# Altium project NewTracker.PrjPcb (part 1 of 4)
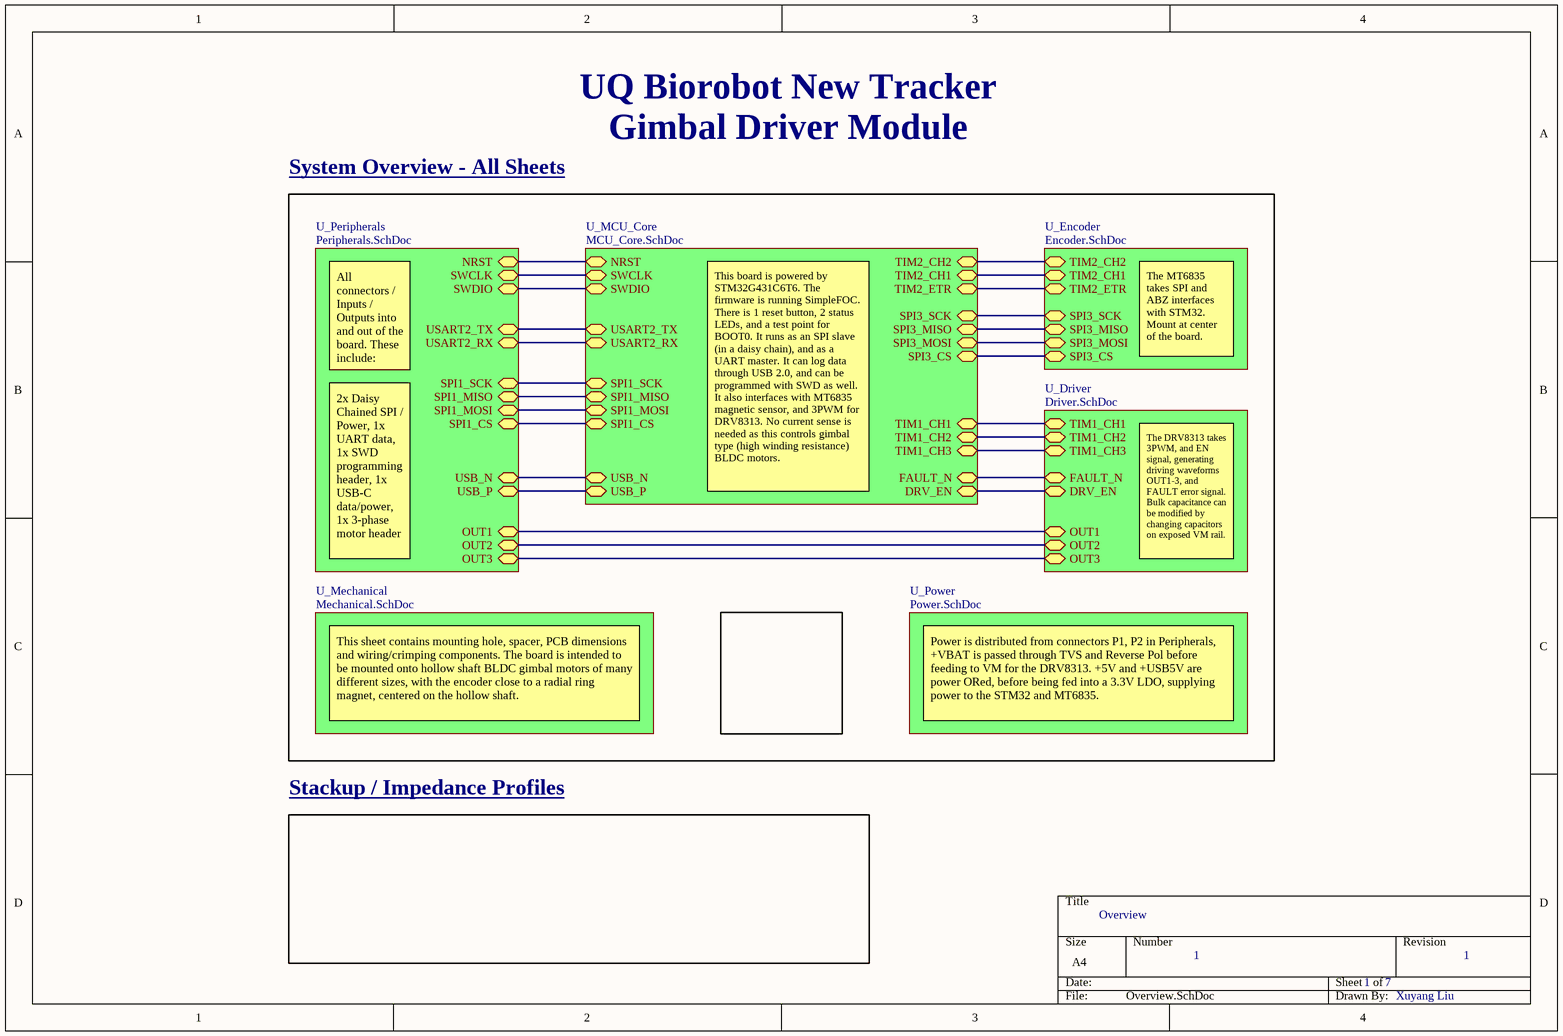
[diagram p0: Overview.SchDoc]
7 sheets, 99 parts. Net scope: hierarchical (ports join the sheet entries above them; power ports are global).
Board file: NewTrackerBoard.PcbDoc
Sheets:
  Overview.SchDoc
    U_MCU_Core = MCU_Core.SchDoc
    U_Peripherals = Peripherals.SchDoc
    U_Power = Power.SchDoc
    U_Driver = Driver.SchDoc
    U_Encoder = Encoder.SchDoc
    U_Mechanical = Mechanical.SchDoc

## Sheet Overview.SchDoc
size A4; SheetNumber: 1; SheetTotal: 7

### Sub-sheets
U_Driver = Driver.SchDoc: FAULT_N (bidir), DRV_EN (bidir), TIM1_CH1 (bidir), TIM1_CH3 (bidir), TIM1_CH2 (bidir), OUT2 (bidir), OUT1 (bidir), OUT3 (bidir)
U_Encoder = Encoder.SchDoc: SPI3_CS (bidir), SPI3_MOSI (bidir), SPI3_MISO (bidir), SPI3_SCK (bidir), TIM2_CH2 (bidir), TIM2_CH1 (bidir), TIM2_ETR (bidir)
U_MCU_Core = MCU_Core.SchDoc: SPI3_CS (bidir), SPI3_MOSI (bidir), SPI3_MISO (bidir), SPI3_SCK (bidir), SPI1_CS (bidir), SWCLK (bidir), SWDIO (bidir), TIM1_CH3 (bidir), TIM1_CH2 (bidir), TIM1_CH1 (bidir), SPI1_MOSI (bidir), SPI1_MISO (bidir), SPI1_SCK (bidir), USART2_RX (bidir), USART2_TX (bidir), TIM2_CH2 (bidir), TIM2_CH1 (bidir), USB_N (bidir), USB_P (bidir), TIM2_ETR (bidir), NRST (bidir), FAULT_N (bidir), DRV_EN (bidir)
U_Mechanical = Mechanical.SchDoc: no entries
U_Peripherals = Peripherals.SchDoc: USB_N (bidir), USB_P (bidir), SPI1_SCK (bidir), SPI1_MOSI (bidir), SPI1_MISO (bidir), SPI1_CS (bidir), USART2_TX (bidir), USART2_RX (bidir), NRST (bidir), SWCLK (bidir), SWDIO (bidir), OUT1 (bidir), OUT3 (bidir), OUT2 (bidir)
U_Power = Power.SchDoc: no entries

### Nets
DRV_EN: sheet U_MCU_Core/DRV_EN, sheet U_Driver/DRV_EN
FAULT_N: sheet U_MCU_Core/FAULT_N, sheet U_Driver/FAULT_N
NRST: sheet U_MCU_Core/NRST, sheet U_Peripherals/NRST
OUT1: sheet U_Peripherals/OUT1, sheet U_Driver/OUT1
OUT2: sheet U_Peripherals/OUT2, sheet U_Driver/OUT2
OUT3: sheet U_Peripherals/OUT3, sheet U_Driver/OUT3
SPI1_CS: sheet U_MCU_Core/SPI1_CS, sheet U_Peripherals/SPI1_CS
SPI1_MISO: sheet U_MCU_Core/SPI1_MISO, sheet U_Peripherals/SPI1_MISO
SPI1_MOSI: sheet U_MCU_Core/SPI1_MOSI, sheet U_Peripherals/SPI1_MOSI
SPI1_SCK: sheet U_MCU_Core/SPI1_SCK, sheet U_Peripherals/SPI1_SCK
SPI3_CS: sheet U_MCU_Core/SPI3_CS, sheet U_Encoder/SPI3_CS
SPI3_MISO: sheet U_MCU_Core/SPI3_MISO, sheet U_Encoder/SPI3_MISO
SPI3_MOSI: sheet U_MCU_Core/SPI3_MOSI, sheet U_Encoder/SPI3_MOSI
SPI3_SCK: sheet U_MCU_Core/SPI3_SCK, sheet U_Encoder/SPI3_SCK
SWCLK: sheet U_MCU_Core/SWCLK, sheet U_Peripherals/SWCLK
SWDIO: sheet U_MCU_Core/SWDIO, sheet U_Peripherals/SWDIO
TIM1_CH1: sheet U_MCU_Core/TIM1_CH1, sheet U_Driver/TIM1_CH1
TIM1_CH2: sheet U_MCU_Core/TIM1_CH2, sheet U_Driver/TIM1_CH2
TIM1_CH3: sheet U_MCU_Core/TIM1_CH3, sheet U_Driver/TIM1_CH3
TIM2_CH1: sheet U_MCU_Core/TIM2_CH1, sheet U_Encoder/TIM2_CH1
TIM2_CH2: sheet U_MCU_Core/TIM2_CH2, sheet U_Encoder/TIM2_CH2
TIM2_ETR: sheet U_MCU_Core/TIM2_ETR, sheet U_Encoder/TIM2_ETR
USART2_RX: sheet U_MCU_Core/USART2_RX, sheet U_Peripherals/USART2_RX
USART2_TX: sheet U_MCU_Core/USART2_TX, sheet U_Peripherals/USART2_TX
USB_N: sheet U_MCU_Core/USB_N, sheet U_Peripherals/USB_N
USB_P: sheet U_MCU_Core/USB_P, sheet U_Peripherals/USB_P

### Notes on the sheet
- UQ Biorobot New Tracker
- System Overview - All Sheets
- Gimbal Driver Module
- All connectors / Inputs / Outputs into and out of the board. These include:
- The MT6835 takes SPI and ABZ interfaces with STM32. Mount at center of the board.
- This board is powered by STM32G431C6T6. The firmware is running SimpleFOC. There is 1 reset button, 2 status LEDs, and a test point for BOOT0. It runs as an SPI slave (in a daisy chain), and as a UART master. It can log data through USB 2.0, and can be programmed with SWD as well. It also interfaces with MT6835 magnetic sensor, and 3PWM for DRV8313. No current sense is needed as this controls gimbal type (high winding resistance) BLDC motors.
- 2x Daisy Chained SPI / Power, 1x UART data, 1x SWD programming header, 1x USB-C data/power, 1x 3-phase motor header
- The DRV8313 takes 3PWM, and EN signal, generating driving waveforms OUT1-3, and FAULT error signal. Bulk capacitance can be modified by changing capacitors on exposed VM rail.
- This sheet contains mounting hole, spacer, PCB dimensions and wiring/crimping components. The board is intended to be mounted onto hollow shaft BLDC gimbal motors of many different sizes, with the encoder close to a radial ring magnet, centered on the hollow shaft.
- Power is distributed from connectors P1, P2 in Peripherals, +VBAT is passed through TVS and Reverse Pol before feeding to VM for the DRV8313. +5V and +USB5V are power ORed, before being fed into a 3.3V LDO, supplying power to the STM32 and MT6835.
- Stackup / Impedance Profiles
- Overview
- 1
- 1     7
- Xuyang Liu

## Sheet MCU_Core.SchDoc
size A4; SheetNumber: 2; SheetTotal: 7
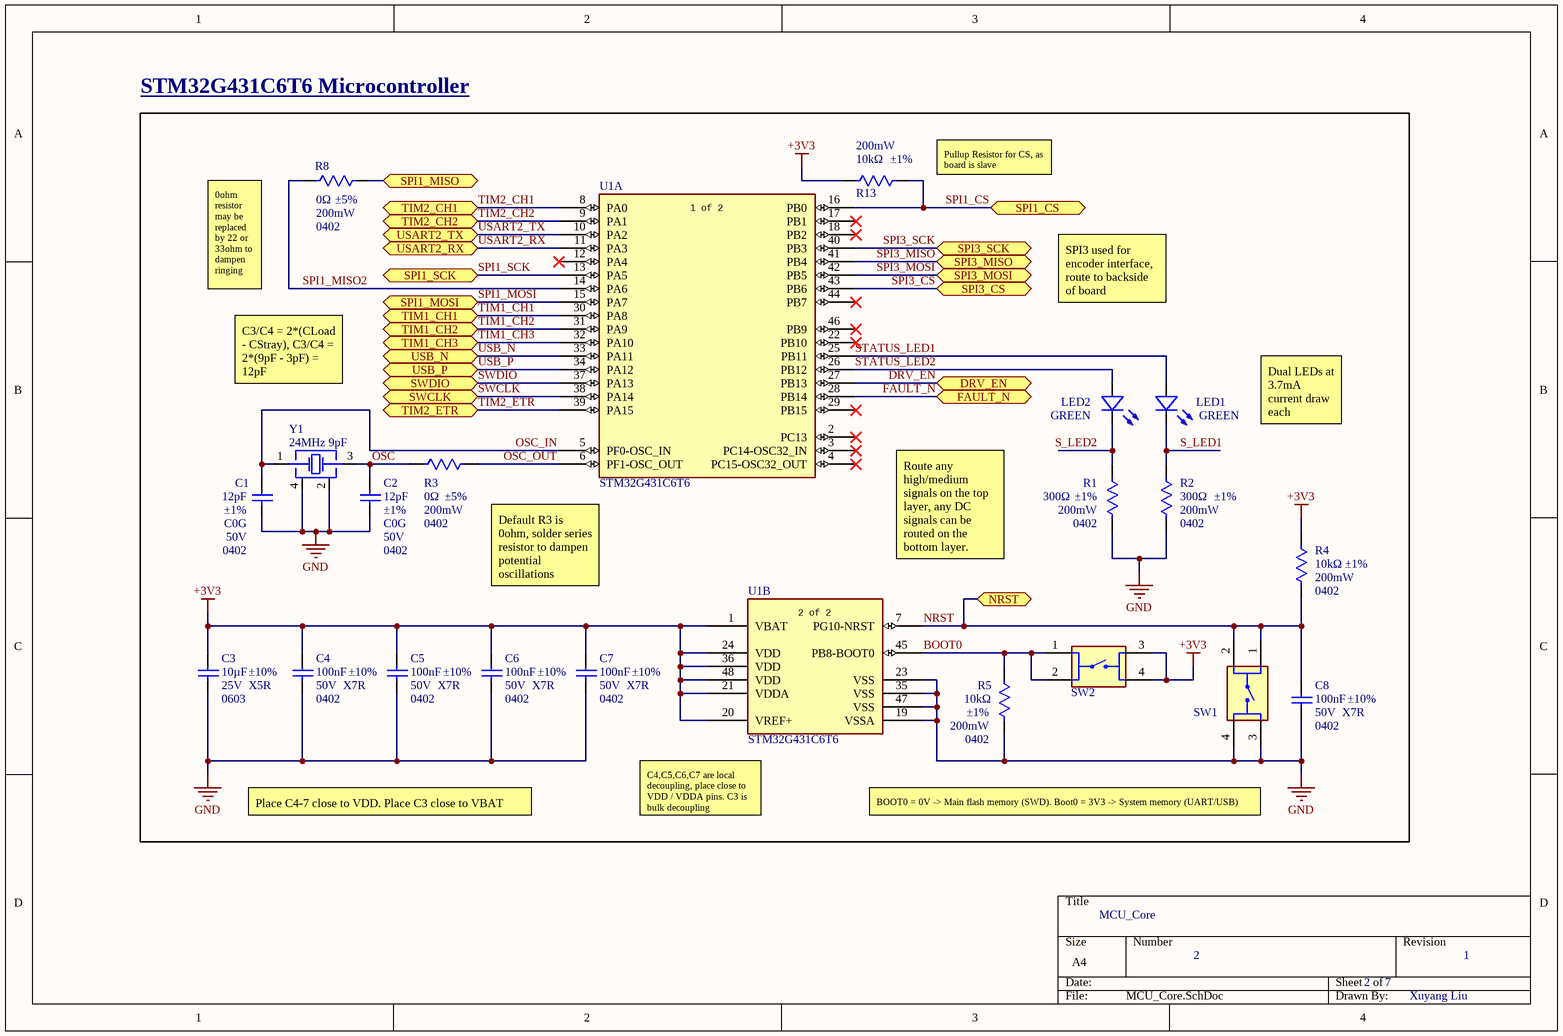
[diagram p1: MCU_Core.SchDoc]

### Parts
C1  Voltage Rating: 50V  Tolerance: ±1%  Dielectric: C0G  Case/Package: 0402  [0402_Cap]  (hidden comment: 12pF)
C2  Voltage Rating: 50V  Tolerance: ±1%  Dielectric: C0G  Case/Package: 0402  [0402_Cap]  (hidden comment: 12pF)
C3  Voltage Rating: 25V  Tolerance: ±10%  Dielectric: X5R  Case/Package: 0603  Capacitance: 10µF  [0603_CAP]  (hidden comment: 10uF)
C4  Case/Package: 0402  Voltage Rating: 50V  Dielectric: X7R  Tolerance: ±10%  [0402_Cap]  (hidden comment: 100nF)
C5  Case/Package: 0402  Voltage Rating: 50V  Dielectric: X7R  Tolerance: ±10%  [0402_Cap]  (hidden comment: 100nF)
C6  Case/Package: 0402  Voltage Rating: 50V  Dielectric: X7R  Tolerance: ±10%  [0402_Cap]  (hidden comment: 100nF)
C7  Case/Package: 0402  Voltage Rating: 50V  Dielectric: X7R  Tolerance: ±10%  [0402_Cap]  (hidden comment: 100nF)
C8  Case/Package: 0402  Voltage Rating: 50V  Dielectric: X7R  Tolerance: ±10%  [0402_Cap]  (hidden comment: 100nF)
LED1  GREEN  [0603_LED]
LED2  GREEN  [0603_LED]
R1  Tolerance: ±1%  Max Power Dissipation: 200mW  Case/Package: 0402  Resistance: 300Ω  [0402_RES]  (hidden comment: 300R)
R2  Tolerance: ±1%  Max Power Dissipation: 200mW  Case/Package: 0402  Resistance: 300Ω  [0402_RES]  (hidden comment: 300R)
R3  Tolerance: ±5%  Power Rating: 200mW  Case/Package: 0402  Resistance: 0Ω  [0402_RES]  (hidden comment: 0R)
R4  Tolerance: ±1%  Power Rating: 200mW  Case/Package: 0402  Resistance: 10kΩ  [0402_RES]  (hidden comment: 10K)
R5  Tolerance: ±1%  Power Rating: 200mW  Case/Package: 0402  Resistance: 10kΩ  [0402_RES]  (hidden comment: 10K)
R8  Tolerance: ±5%  Power Rating: 200mW  Case/Package: 0402  Resistance: 0Ω  [0402_RES]  (hidden comment: 0R)
R13  Tolerance: ±1%  Power Rating: 200mW  Resistance: 10kΩ  [0402_RES]  (hidden comment: 10K)
SW1  PTS810SJM250SMTRLFS  [SW4_PTS815 SJM 250 SMTR LFS_CNK]  (value not drawn)
SW2  SPST N.O. Button  [SW4_PTS815 SJM 250 SMTR LFS_CNK]  (value not drawn)
U1  STM32G431C6T6  [LQFP48-7x7mm]  (parts A,B of 2)
Y1  24MHz 9pF  [OSCCC320X250X60]

### Blocks framed on the sheet
STM32G431C6T6 Microcontroller: C1-C8 LED1 LED2 R1-R5 R8 R13 SW1 SW2 U1 Y1

### Ports
DRV_EN (bidir), FAULT_N (bidir), NRST (bidir), SPI1_CS (bidir), SPI1_MISO (bidir), SPI1_MOSI (bidir), SPI1_SCK (bidir), SPI3_CS (bidir), SPI3_MISO (bidir), SPI3_MOSI (bidir), SPI3_SCK (bidir), SWCLK (bidir), SWDIO (bidir), TIM1_CH1 (bidir), TIM1_CH2 (bidir), TIM1_CH3 (bidir), TIM2_CH1 (bidir), TIM2_CH2 (bidir), TIM2_ETR (bidir), USART2_RX (bidir), USART2_TX (bidir), USB_N (bidir), USB_P (bidir)

### Nets
+3V3: C3.2 C4.2 C5.2 C6.2 C7.2 R4.2 R13.1 SW2.3 SW2.4 U1.1(VBAT) U1.20(VREF+) U1.21(VDDA) U1.24(VDD) U1.36(VDD) U1.48(VDD)
GND: C1.1 C2.1 C3.1 C4.1 C5.1 C6.1 C7.1 C8.1 R1.1 R2.2 R5.1 SW1.3 SW1.4 U1.19(VSSA) U1.23(VSS) U1.35(VSS) U1.47(VSS) Y1.2 Y1.4
BOOT0: R5.2 SW2.1 SW2.2 U1.45(PB8-BOOT0)
DRV_EN: U1.27(PB13) ; port DRV_EN
FAULT_N: U1.28(PB14) ; port FAULT_N
NRST: C8.2 R4.1 SW1.1 SW1.2 U1.7(PG10-NRST) ; port NRST
OSC: C2.2 R3.1 Y1.3
OSC_IN: C1.2 U1.5(PF0-OSC_IN) Y1.1
OSC_OUT: R3.2 U1.6(PF1-OSC_OUT)
S_LED1: LED1.C(V-) R2.1
S_LED2: LED2.C(V-) R1.2
SPI1_CS: R13.2 U1.16(PB0) ; port SPI1_CS
SPI1_MISO: R8.2 ; port SPI1_MISO
SPI1_MISO2: R8.1 U1.14(PA6)
SPI1_MOSI: U1.15(PA7) ; port SPI1_MOSI
SPI1_SCK: U1.13(PA5) ; port SPI1_SCK
SPI3_CS: U1.43(PB6) ; port SPI3_CS
SPI3_MISO: U1.41(PB4) ; port SPI3_MISO
SPI3_MOSI: U1.42(PB5) ; port SPI3_MOSI
SPI3_SCK: U1.40(PB3) ; port SPI3_SCK
STATUS_LED1: LED1.A(V+) U1.25(PB11)
STATUS_LED2: LED2.A(V+) U1.26(PB12)
SWCLK: U1.38(PA14) ; port SWCLK
SWDIO: U1.37(PA13) ; port SWDIO
TIM1_CH1: U1.30(PA8) ; port TIM1_CH1
TIM1_CH2: U1.31(PA9) ; port TIM1_CH2
TIM1_CH3: U1.32(PA10) ; port TIM1_CH3
TIM2_CH1: U1.8(PA0) ; port TIM2_CH1
TIM2_CH2: U1.9(PA1) ; port TIM2_CH2
TIM2_ETR: U1.39(PA15) ; port TIM2_ETR
USART2_RX: U1.11(PA3) ; port USART2_RX
USART2_TX: U1.10(PA2) ; port USART2_TX
USB_N: U1.33(PA11) ; port USB_N
USB_P: U1.34(PA12) ; port USB_P

Not connected (* = marked no-connect by the designer): U1 2(PC13)* 3(PC14-OSC32_IN)* 4(PC15-OSC32_OUT)* 12(PA4)* 17(PB1)* 18(PB2)* 22(PB10)* 29(PB15)* 44(PB7)* 46(PB9)*

### Notes on the sheet
- (near R13) Pullup Resistor for CS, as board is slave
- 0ohm resistor may be replaced by 22 or 33ohm to dampen ringing
- SPI3 used for encoder interface, route to backside of board
- C3/C4 = 2*(CLoad - CStray), C3/C4 = 2*(9pF - 3pF) = 12pF
- Dual LEDs at 3.7mA current draw each
- Default R3 is 0ohm, solder series resistor to dampen potential oscillations
- Route any high/medium signals on the top layer, any DC signals can be routed on the bottom layer.
- Place C4-7 close to VDD. Place C3 close to VBAT
- (near U1) C4,C5,C6,C7 are local decoupling, place close to VDD / VDDA pins. C3 is bulk decoupling
- BOOT0 = 0V -> Main flash memory (SWD). Boot0 = 3V3 -> System memory (UART/USB)
- MCU_Core
- 2
- 2     7
- 1
- Xuyang Liu
- (in symbol STM32G431C6T6, part A) 1 of 2
- (in symbol STM32G431C6T6, part B) 2 of 2

### Library data of the parts
C1 C2 = GJM1555C1H120FB01D: 12 pF, 50 V, ± 1%, C0G (NP0), 0402 [1005 Metric]; Manufacturer: Murata; Manufacturer Lifecycle Status: IN PRODUCTION; Dielectric Material: Ceramic; Temperature Coefficient: 30ppm/°C; Supplier 1: DigiKey; Manufacturer Part Number: GJM1555C1H120FB01D; RoHS: Compliant; Category: Ceramic Capacitors; Stock 1: 7555649; Pricing 1: 1=0.16, 10=0.089, 50=0.0628, 100=0.0546, 500=0.04104, 1000=0.03687, 2500=0.03246, 5000=0.02982 (USD); Case Code (Imperial): 0402; Case Code (Metric): 1005; Depth: 500µm; Export Control Classification Number (ECCN) Code: EAR99; Height: 500µm; Harmonized Tariff Schedule (HTS) Code: 8532.24.00.20; Introduction Date: 2013-11-20; Length: 1mm; Lifecycle Status: Production; Material: Ceramic; Max Operating Temperature: 125°C; Min Operating Temperature: -55°C; Mount: Surface Mount; Number of Terminals: 2; Radiation Hardening: No; REACH SVHC: Yes; Schedule B: 8532240020, 8532240020|8532240020|8532240020|8532240020|8532240020; Termination: SMD/SMT; Thickness: 500µm; Voltage Rating (DC): 50V; Width: 500µm; ComponentLink1URL: https://datasheet.octopart.com:443/GJM1555C1H120FB01D-Murata-datasheet-165579666.pdf?src-supplier=TME; ComponentLink1Description: https://datasheet.octopart.com:443/GJM1555C1H120FB01D-Murata-datasheet-165579666.pdf?src-supplier=TME; ComponentLink2URL: https://datasheet.octopart.com:443/GJM1555C1H120FB01D-Murata-datasheet-12511495.pdf?src-supplier=TME; ComponentLink2Description: https://datasheet.octopart.com:443/GJM1555C1H120FB01D-Murata-datasheet-12511495.pdf?src-supplier=TME; ComponentLink3URL: https://datasheet.octopart.com:443/GJM1555C1H120FB01D-Murata-datasheet-141266224.pdf?src-supplier=Ciiva; ComponentLink3Description: https://datasheet.octopart.com:443/GJM1555C1H120FB01D-Murata-datasheet-141266224.pdf?src-supplier=Ciiva; ComponentLink4URL: https://datasheet.octopart.com:443/GJM1555C1H120FB01D-Murata-datasheet-140665264.pdf?src-supplier=Ciiva; ComponentLink4Description: https://datasheet.octopart.com:443/GJM1555C1H120FB01D-Murata-datasheet-140665264.pdf?src-supplier=Ciiva; ComponentLink5URL: https://datasheet.octopart.com:443/GJM1555C1H120FB01D-Murata-datasheet-138724487.pdf?src-supplier=Ciiva; ComponentLink5Description: https://datasheet.octopart.com:443/GJM1555C1H120FB01D-Murata-datasheet-138724487.pdf?src-supplier=Ciiva; ComponentLink6URL: https://datasheet.octopart.com/GJM1555C1H120FB01D-Murata-datasheet-12515295.pdf; ComponentLink6Description: https://datasheet.octopart.com/GJM1555C1H120FB01D-Murata-datasheet-12515295.pdf; ComponentLink7URL: https://datasheet.octopart.com/GJM1555C1H120FB01D-Murata-datasheet-12510076.pdf; ComponentLink7Description: https://datasheet.octopart.com/GJM1555C1H120FB01D-Murata-datasheet-12510076.pdf; ComponentLink8URL: https://datasheet.octopart.com/GJM1555C1H120FB01D-Murata-datasheet-11978611.pdf; ComponentLink8Description: https://datasheet.octopart.com/GJM1555C1H120FB01D-Murata-datasheet-11978611.pdf; ComponentLink9URL: https://datasheet.octopart.com/GJM1555C1H120FB01D-Murata-datasheet-10025737.pdf; ComponentLink9Description: https://datasheet.octopart.com/GJM1555C1H120FB01D-Murata-datasheet-10025737.pdf; ComponentLink10URL: https://datasheet.octopart.com/GJM1555C1H120FB01D-Murata-datasheet-8819587.pdf; ComponentLink10Description: https://datasheet.octopart.com/GJM1555C1H120FB01D-Murata-datasheet-8819587.pdf; ComponentLink11URL: https://datasheet.octopart.com/GJM1555C1H120FB01D-Murata-datasheet-14407173.pdf; ComponentLink11Description: https://datasheet.octopart.com/GJM1555C1H120FB01D-Murata-datasheet-14407173.pdf; ComponentLink12URL: http://sigma.octopart.com:80/reach_statement/Murata-company-16.pdf?src-supplier=Compliance+Statements; ComponentLink12Description: http://sigma.octopart.com:80/reach_statement/Murata-company-16.pdf?src-supplier=Compliance+Statements; Supplier Part Number 1: 490-11190-1-ND; Capacitance: 12pF
C3 = GRM188R61E106KA73J: 25V 10uF X5R ±10% 0603 Multilayer Ceramic Capacitors MLCC - SMD/SMT ROHS; Manufacturer: Murata; Manufacturer Lifecycle Status: IN PRODUCTION; Supplier 1: DigiKey; Manufacturer Part Number: GRM188R61E106KA73J; RoHS: Compliant; Category: Ceramic Capacitors; Stock 1: 170211; Pricing 1: 1=0.26, 10=0.149, 50=0.1072, 100=0.0945, 500=0.07304, 1000=0.06643, 2500=0.05947, 5000=0.05528 (USD); Dielectric Material: Ceramic; Height: 800µm; Length: 1.6mm; Lifecycle Status: Production; Material: Ceramic; Max Operating Temperature: 85°C; Min Operating Temperature: -55°C; Mount: Surface Mount; Number of Terminals: 2; REACH SVHC: Yes; Thickness: 800µm; Voltage Rating (DC): 25V; Width: 800µm; ComponentLink1URL: https://datasheet.octopart.com:443/GRM188R61E106KA73J-Murata-datasheet-165579666.pdf?src-supplier=TME; ComponentLink1Description: https://datasheet.octopart.com:443/GRM188R61E106KA73J-Murata-datasheet-165579666.pdf?src-supplier=TME; ComponentLink2URL: https://datasheet.octopart.com:443/GRM188R61E106KA73J-Murata-datasheet-141274968.pdf?src-supplier=Ciiva; ComponentLink2Description: https://datasheet.octopart.com:443/GRM188R61E106KA73J-Murata-datasheet-141274968.pdf?src-supplier=Ciiva; ComponentLink3URL: https://datasheet.octopart.com:443/GRM188R61E106KA73J-Murata-datasheet-140704821.pdf?src-supplier=Ciiva; ComponentLink3Description: https://datasheet.octopart.com:443/GRM188R61E106KA73J-Murata-datasheet-140704821.pdf?src-supplier=Ciiva; ComponentLink4URL: https://datasheet.octopart.com:443/GRM188R61E106KA73J-Murata-datasheet-138742889.pdf?src-supplier=Ciiva; ComponentLink4Description: https://datasheet.octopart.com:443/GRM188R61E106KA73J-Murata-datasheet-138742889.pdf?src-supplier=Ciiva; ComponentLink5URL: https://datasheet.octopart.com/GRM188R61E106KA73J-Murata-datasheet-12515295.pdf; ComponentLink5Description: https://datasheet.octopart.com/GRM188R61E106KA73J-Murata-datasheet-12515295.pdf; ComponentLink6URL: https://datasheet.octopart.com/GRM188R61E106KA73J-Murata-datasheet-12510076.pdf; ComponentLink6Description: https://datasheet.octopart.com/GRM188R61E106KA73J-Murata-datasheet-12510076.pdf; ComponentLink7URL: https://datasheet.octopart.com/GRM188R61E106KA73J-Murata-datasheet-11978611.pdf; ComponentLink7Description: https://datasheet.octopart.com/GRM188R61E106KA73J-Murata-datasheet-11978611.pdf; ComponentLink8URL: https://datasheet.octopart.com/GRM188R61E106KA73J-Murata-datasheet-10025737.pdf; ComponentLink8Description: https://datasheet.octopart.com/GRM188R61E106KA73J-Murata-datasheet-10025737.pdf; ComponentLink9URL: https://datasheet.octopart.com/GRM188R61E106KA73J-Murata-datasheet-8819587.pdf; ComponentLink9Description: https://datasheet.octopart.com/GRM188R61E106KA73J-Murata-datasheet-8819587.pdf; ComponentLink10URL: http://sigma.octopart.com:80/reach_statement/Murata-company-16.pdf?src-supplier=Compliance+Statements; ComponentLink10Description: http://sigma.octopart.com:80/reach_statement/Murata-company-16.pdf?src-supplier=Compliance+Statements; Supplier Part Number 1: 490-GRM188R61E106KA73JCT-ND
C4-C8 = GCM155R71H104KE02J: 50V 100nF X7R ±10% 0402 Multilayer Ceramic Capacitors MLCC - SMD/SMT ROHS; Manufacturer: Murata; Manufacturer Lifecycle Status: IN PRODUCTION; Supplier 1: DigiKey; Manufacturer Part Number: GCM155R71H104KE02J; RoHS: Compliant; Category: Ceramic Capacitors; Stock 1: 13930662; Pricing 1: 1=0.1, 10=0.034, 50=0.0226, 100=0.0193, 500=0.01374, 1000=0.01205, 2500=0.01027, 5000=0.0092 (USD); Case Code (Imperial): 0402; Case Code (Metric): 1005; Country of Origin: Philippines; Dielectric Material: Ceramic; Export Control Classification Number (ECCN) Code: EAR99; Height: 500µm; Harmonized Tariff Schedule (HTS) Code: 8532.24.00.20; Introduction Date: 2013-11-20; Length: 1mm; Lifecycle Status: Production; Material: Ceramic; Max Operating Temperature: 125°C; Min Operating Temperature: -55°C; Mount: Surface Mount; Number of Terminals: 2; Packaging: Tape & Reel (TR); Ratings: AEC-Q200; REACH SVHC: Yes; Schedule B: 8532240020, 8532240020|8532240020, 8532240020|8532240020|8532240020, 8532240020|8532240020|8532240020|8532240020; Termination: SMD/SMT; Voltage Rating (DC): 50V; Weight: 6.010099mg; Width: 500µm; ComponentLink1URL: https://datasheet.octopart.com:443/GCM155R71H104KE02J-Murata-datasheet-155345015.pdf?src-supplier=Newark; ComponentLink1Description: https://datasheet.octopart.com:443/GCM155R71H104KE02J-Murata-datasheet-155345015.pdf?src-supplier=Newark; ComponentLink2URL: https://datasheet.octopart.com:443/GCM155R71H104KE02J-Murata-datasheet-178519985.pdf?src-supplier=Arrow.cn; ComponentLink2Description: https://datasheet.octopart.com:443/GCM155R71H104KE02J-Murata-datasheet-178519985.pdf?src-supplier=Arrow.cn; ComponentLink3URL: https://datasheet.octopart.com:443/GCM155R71H104KE02J-Murata-datasheet-141266224.pdf?src-supplier=Ciiva; ComponentLink3Description: https://datasheet.octopart.com:443/GCM155R71H104KE02J-Murata-datasheet-141266224.pdf?src-supplier=Ciiva; ComponentLink4URL: https://datasheet.octopart.com:443/GCM155R71H104KE02J-Murata-datasheet-140656751.pdf?src-supplier=Ciiva; ComponentLink4Description: https://datasheet.octopart.com:443/GCM155R71H104KE02J-Murata-datasheet-140656751.pdf?src-supplier=Ciiva; ComponentLink5URL: https://datasheet.octopart.com:443/GCM155R71H104KE02J-Murata-datasheet-138716456.pdf?src-supplier=Ciiva; ComponentLink5Description: https://datasheet.octopart.com:443/GCM155R71H104KE02J-Murata-datasheet-138716456.pdf?src-supplier=Ciiva; ComponentLink6URL: https://datasheet.octopart.com:443/GCM155R71H104KE02J-Murata-datasheet-77992203.pdf?src-supplier=Future+Electronics; ComponentLink6Description: https://datasheet.octopart.com:443/GCM155R71H104KE02J-Murata-datasheet-77992203.pdf?src-supplier=Future+Electronics; ComponentLink7URL: https://datasheet.octopart.com:443/GCM155R71H104KE02J-Murata-datasheet-12511495.pdf?src-supplier=TME; ComponentLink7Description: https://datasheet.octopart.com:443/GCM155R71H104KE02J-Murata-datasheet-12511495.pdf?src-supplier=TME; ComponentLink8URL: http://sigma.octopart.com:80/reach_statement/Murata-company-16.pdf?src-supplier=Compliance+Statements; ComponentLink8Description: http://sigma.octopart.com:80/reach_statement/Murata-company-16.pdf?src-supplier=Compliance+Statements; Supplier Part Number 1: 490-14514-6-ND; Capacitance: 100nF
LED1 LED2 = LTST-C190KGKT: LED yellow green 0603 wavelength 567.5nm~576.5nm light intensity 18mcd~71mcd Front Mounting; Manufacturer: Diodes Inc.; Dominant Wavelength: 571nm; Forward Current: 30mA; Forward Voltage: 2.15V; Lens Color: Clear, Colorless; Lens Style: Clear; Luminous Intensity: 35mcd; Number of Circuits: 1; Peak Wavelength: 574nm; Power Dissipation: 75mW; Reverse Voltage: 5V; Shape: Rectangular; Test Current: 20mA; Viewing Angle: 130°; Supplier 1: DigiKey; Manufacturer Part Number: LTST-C190KGKT; RoHS: Compliant; Category: LEDs; Stock 1: 2033232; Pricing 1: 1=0.13, 10=0.088, 100=0.0603, 500=0.04758, 1000=0.04332, 2000=0.03968 (USD); Case/Package: 0603; Case Code (Imperial): 0603; Case Code (Metric): 1608; China RoHS: Compliant; Color: Green; Depth: 800µm; Height: 800µm; Illumination Color: Green; Lead Free: Lead Free; Length: 1.6mm; Lens Transparency: Clear; Lifecycle Status: Production; Max Operating Temperature: 85°C; Min Operating Temperature: -30°C; Mount: Surface Mount; Number of Elements: 1; Number of LEDs: 1; Number of Pins: 2; Number of Terminals: 2; Power Rating: 75mW; Radiation Hardening: No; REACH SVHC: Yes; Schedule B: 8541402000, 8541402000|8541402000|8541402000|8541402000|8541402000|8541402000|8541402000|8541402000|8541402000|8541402000|8541402000|8541402000|8541402000|8541402000|8541402000|8541402000|8541402000|8541402000|8541402000|8541402000|8541402000|8541402000|8541402000|85; Terminal Pitch: 1.5mm; Wavelength: 574nm; Width: 800µm; ComponentLink1URL: https://datasheet.octopart.com:443/LTST-C190KGKT-Lite-On-datasheet-86397316.pdf?src-supplier=ODG+(Origin+Data+Global); ComponentLink1Description: https://datasheet.octopart.com:443/LTST-C190KGKT-Lite-On-datasheet-86397316.pdf?src-supplier=ODG+(Origin+Data+Global); ComponentLink2URL: https://datasheet.octopart.com:443/LTST-C190KGKT-Lite-On-datasheet-180605179.pdf?src-supplier=IHS; ComponentLink2Description: https://datasheet.octopart.com:443/LTST-C190KGKT-Lite-On-datasheet-180605179.pdf?src-supplier=IHS; ComponentLink3URL: https://datasheet.octopart.com:443/LTST-C190KGKT-Lite-On-datasheet-13693967.pdf?src-supplier=Factory+Futures; ComponentLink3Description: https://datasheet.octopart.com:443/LTST-C190KGKT-Lite-On-datasheet-13693967.pdf?src-supplier=Factory+Futures; ComponentLink4URL: https://datasheet.octopart.com:443/LTST-C190KGKT-Lite-On-datasheet-165573809.pdf?src-supplier=TME; ComponentLink4Description: https://datasheet.octopart.com:443/LTST-C190KGKT-Lite-On-datasheet-165573809.pdf?src-supplier=TME; ComponentLink5URL: https://datasheet.octopart.com:443/LTST-C190KGKT-Lite-On-datasheet-165573808.pdf?src-supplier=TME; ComponentLink5Description: https://datasheet.octopart.com:443/LTST-C190KGKT-Lite-On-datasheet-165573808.pdf?src-supplier=TME; ComponentLink6URL: https://datasheet.octopart.com:443/LTST-C190KGKT-Lite-On-datasheet-43775815.pdf?src-supplier=TME; ComponentLink6Description: https://datasheet.octopart.com:443/LTST-C190KGKT-Lite-On-datasheet-43775815.pdf?src-supplier=TME; ComponentLink7URL: https://datasheet.octopart.com:443/LTST-C190KGKT-Lite-On-datasheet-32046999.pdf?src-supplier=Future+Electronics; ComponentLink7Description: https://datasheet.octopart.com:443/LTST-C190KGKT-Lite-On-datasheet-32046999.pdf?src-supplier=Future+Electronics; ComponentLink8URL: https://datasheet.octopart.com:443/LTST-C190KGKT-Lite-On-datasheet-8326678.pdf?src-supplier=Future+Electronics; ComponentLink8Description: https://datasheet.octopart.com:443/LTST-C190KGKT-Lite-On-datasheet-8326678.pdf?src-supplier=Future+Electronics; ComponentLink9URL: https://datasheet.octopart.com:443/LTST-C190KGKT-Lite-On-datasheet-78838574.pdf?src-supplier=Future+Electronics; ComponentLink9Description: https://datasheet.octopart.com:443/LTST-C190KGKT-Lite-On-datasheet-78838574.pdf?src-supplier=Future+Electronics; ComponentLink10URL: https://datasheet.octopart.com:443/LTST-C190KGKT-Lite-On-datasheet-158288.pdf?src-supplier=Mouser; ComponentLink10Description: https://datasheet.octopart.com:443/LTST-C190KGKT-Lite-On-datasheet-158288.pdf?src-supplier=Mouser; ComponentLink11URL: https://datasheet.octopart.com:443/LTST-C190KGKT-Lite-On-datasheet-49281.pdf?src-supplier=DigiKey; ComponentLink11Description: https://datasheet.octopart.com:443/LTST-C190KGKT-Lite-On-datasheet-49281.pdf?src-supplier=DigiKey; ComponentLink12URL: https://datasheet.octopart.com:443/LTST-C190KGKT-Lite-On-datasheet-14174998.pdf?src-supplier=iiiC; ComponentLink12Description: https://datasheet.octopart.com:443/LTST-C190KGKT-Lite-On-datasheet-14174998.pdf?src-supplier=iiiC
R1 R2 = RCS0402300RFKED: 300Ω RCS e3 0402 0402 (1005Metric) Chip Resistor ±1% ±100ppm/C 300Ohms 0.2W 1/5W; Manufacturer: Vishay; Temperature Coefficient: 100ppm/°C; Working Voltage: 50V; Supplier 1: DigiKey; Manufacturer Part Number: RCS0402300RFKED; RoHS: Compliant; Category: Chip SMD Resistors; Stock 1: 8281; Pricing 1: 1=0.13, 10=0.06, 25=0.0464, 50=0.0386, 100=0.0325, 250=0.0264, 500=0.02292, 1000=0.02015, 5000=0.01575 (USD); China RoHS: Non-Compliant; Composition: Thick Film; Country of Origin: Israel, Mainland China; Export Control Classification Number (ECCN) Code: EAR99; Features: Automotive AEC-Q200; Height: 350µm; Harmonized Tariff Schedule (HTS) Code: 8533.21.00.30; Introduction Date: 2016-07-12; Length: 1mm; Lifecycle Status: Production; Max Operating Temperature: 155°C; Min Operating Temperature: -55°C; Mount: Surface Mount; Number of Terminals: 2; Number of Terminations: 2; Power Rating: 200mW; Ratings: AEC-Q200; REACH SVHC: Yes; Width: 500µm; ComponentLink1URL: https://datasheet.octopart.com:443/RCS0402300RFKED-Vishay-datasheet-176436275.pdf?src-supplier=IHS; ComponentLink1Description: https://datasheet.octopart.com:443/RCS0402300RFKED-Vishay-datasheet-176436275.pdf?src-supplier=IHS; ComponentLink2URL: http://sigma.octopart.com:80/rohs_statement/Vishay-company-15.pdf?src-supplier=Compliance+Statements; ComponentLink2Description: http://sigma.octopart.com:80/rohs_statement/Vishay-company-15.pdf?src-supplier=Compliance+Statements
R3 R8 = RCS04020000Z0ED: 0Ω Resistor, Jumper, 0402 [1005 Metric], Thick Film, 200 mW, 3 A, Surface Mount Device; Manufacturer: Vishay; Max Current Rating: 3A; Voltage Rating: 50V; Supplier 1: DigiKey; Manufacturer Part Number: RCS04020000Z0ED; RoHS: Compliant; Category: Chip SMD Resistors; Stock 1: 775160; Pricing 1: 1=0.1, 10=0.032, 25=0.0268, 50=0.0232, 100=0.0204, 250=0.01728, 500=0.01532, 1000=0.01364, 5000=0.01064 (USD); Case Code (Imperial): 0402; Case Code (Metric): 1005; China RoHS: Non-Compliant; Composition: Thick Film; Country of Origin: Israel, Mainland China; Export Control Classification Number (ECCN) Code: EAR99; Features: Automotive AEC-Q200; Height: 350µm; Harmonized Tariff Schedule (HTS) Code: 8533.21.00.30; Introduction Date: 2016-07-12; Length: 1mm; Lifecycle Status: Production; Max Operating Temperature: 155°C; Max Power Dissipation: 200mW; Min Operating Temperature: -55°C; Mount: Surface Mount; Number of Terminals: 2; Number of Terminations: 2; Ratings: AEC-Q200; REACH SVHC: Yes; Voltage Rating (DC): 50V; Width: 500µm; ComponentLink1URL: https://datasheet.octopart.com:443/RCS04020000Z0ED-Vishay-datasheet-176436275.pdf?src-supplier=IHS; ComponentLink1Description: https://datasheet.octopart.com:443/RCS04020000Z0ED-Vishay-datasheet-176436275.pdf?src-supplier=IHS; ComponentLink2URL: https://datasheet.octopart.com:443/RCS04020000Z0ED-Vishay-datasheet-86813749.pdf?src-supplier=Future+Electronics; ComponentLink2Description: https://datasheet.octopart.com:443/RCS04020000Z0ED-Vishay-datasheet-86813749.pdf?src-supplier=Future+Electronics; ComponentLink3URL: http://sigma.octopart.com:80/rohs_statement/Vishay-company-15.pdf?src-supplier=Compliance+Statements; ComponentLink3Description: http://sigma.octopart.com:80/rohs_statement/Vishay-company-15.pdf?src-supplier=Compliance+Statements; Supplier Part Number 1: 541-2877-6-ND
R4 R5 R13 = CRCW040210K0FKEDHP: 10kΩ Res Thick Film 0402 10K Ohm 1% 0.2W ±100ppm/°C Molded SMD SMD Paper T/R; Manufacturer: Vishay; Manufacturer Package Identifier: CRCW0402-HPe3; Voltage Rating: 50V; Supplier 1: DigiKey; Manufacturer Part Number: CRCW040210K0FKEDHP; RoHS: Compliant; Category: Chip SMD Resistors; Stock 1: 168325; Pricing 1: 1=0.12, 10=0.057, 25=0.0436, 50=0.0362, 100=0.0303, 250=0.02452, 500=0.02122, 1000=0.0186, 5000=0.01445 (USD); Case Code (Imperial): 0402; Case Code (Metric): 1005; China RoHS: Non-Compliant; Composition: Thick Film; Contact Plating: Tin; Country of Origin: Israel, Mainland China; Depth: 500µm; Export Control Classification Number (ECCN) Code: EAR99; Height: 300µm; Harmonized Tariff Schedule (HTS) Code: 8533.21.00.30; Introduction Date: 2008-07-29; Lead Free: Lead Free; Length: 1mm; Lifecycle Status: Production; Max Operating Temperature: 155°C; Military Standard: Not; Min Operating Temperature: -55°C; Mount: Surface Mount; Number of Pins: 2; Number of Terminals: 2; Packaging: Cut Tape; Radiation Hardening: No; Ratings: AEC-Q200; REACH SVHC: Yes; Schedule B: 8533210045; Temperature Coefficient: 100ppm/°C; Termination: SMD/SMT; Voltage Rating (DC): 50V; Weight: 652.039032µg; Width: 500µm; Working Voltage: 50V; ComponentLink1URL: https://datasheet.octopart.com/CRCW040210K0FKEDHP-Vishay-datasheet-83567917.pdf; ComponentLink1Description: https://datasheet.octopart.com/CRCW040210K0FKEDHP-Vishay-datasheet-83567917.pdf; ComponentLink2URL: https://datasheet.octopart.com:443/CRCW040210K0FKEDHP-Vishay-datasheet-13148866.pdf?src-supplier=Newark; ComponentLink2Description: https://datasheet.octopart.com:443/CRCW040210K0FKEDHP-Vishay-datasheet-13148866.pdf?src-supplier=Newark; ComponentLink3URL: https://datasheet.octopart.com:443/CRCW040210K0FKEDHP-Vishay-datasheet-13131392.pdf?src-supplier=Newark; ComponentLink3Description: https://datasheet.octopart.com:443/CRCW040210K0FKEDHP-Vishay-datasheet-13131392.pdf?src-supplier=Newark; ComponentLink4URL: https://datasheet.octopart.com:443/CRCW040210K0FKEDHP-Vishay-datasheet-12593106.pdf?src-supplier=Newark; ComponentLink4Description: https://datasheet.octopart.com:443/CRCW040210K0FKEDHP-Vishay-datasheet-12593106.pdf?src-supplier=Newark; ComponentLink5URL: https://datasheet.octopart.com:443/CRCW040210K0FKEDHP-Vishay-datasheet-12544674.pdf?src-supplier=Newark; ComponentLink5Description: https://datasheet.octopart.com:443/CRCW040210K0FKEDHP-Vishay-datasheet-12544674.pdf?src-supplier=Newark; ComponentLink6URL: https://datasheet.octopart.com:443/CRCW040210K0FKEDHP-Vishay-datasheet-12531795.pdf?src-supplier=Newark; ComponentLink6Description: https://datasheet.octopart.com:443/CRCW040210K0FKEDHP-Vishay-datasheet-12531795.pdf?src-supplier=Newark; ComponentLink7URL: https://datasheet.octopart.com:443/CRCW040210K0FKEDHP-Vishay-datasheet-12518686.pdf?src-supplier=Newark; ComponentLink7Description: https://datasheet.octopart.com:443/CRCW040210K0FKEDHP-Vishay-datasheet-12518686.pdf?src-supplier=Newark; ComponentLink8URL: https://datasheet.octopart.com:443/CRCW040210K0FKEDHP-Vishay-datasheet-12509906.pdf?src-supplier=Newark; ComponentLink8Description: https://datasheet.octopart.com:443/CRCW040210K0FKEDHP-Vishay-datasheet-12509906.pdf?src-supplier=Newark; ComponentLink9URL: https://datasheet.octopart.com:443/CRCW040210K0FKEDHP-Vishay-datasheet-10669844.pdf?src-supplier=Newark; ComponentLink9Description: https://datasheet.octopart.com:443/CRCW040210K0FKEDHP-Vishay-datasheet-10669844.pdf?src-supplier=Newark; ComponentLink10URL: https://datasheet.octopart.com:443/CRCW040210K0FKEDHP-Vishay-datasheet-8703221.pdf?src-supplier=Newark; ComponentLink10Description: https://datasheet.octopart.com:443/CRCW040210K0FKEDHP-Vishay-datasheet-8703221.pdf?src-supplier=Newark; ComponentLink11URL: https://datasheet.octopart.com:443/CRCW040210K0FKEDHP.-Vishay-datasheet-78776210.pdf?src-supplier=Newark; ComponentLink11Description: https://datasheet.octopart.com:443/CRCW040210K0FKEDHP.-Vishay-datasheet-78776210.pdf?src-supplier=Newark; ComponentLink12URL: https://datasheet.octopart.com:443/CRCW040210K0FKEDHP-Vishay-datasheet-21268118.pdf?src-supplier=Newark; ComponentLink12Description: https://datasheet.octopart.com:443/CRCW040210K0FKEDHP-Vishay-datasheet-21268118.pdf?src-supplier=Newark; ComponentLink13URL: https://datasheet.octopart.com:443/CRCW040210K0FKEDHP-Vishay-datasheet-21226360.pdf?src-supplier=Newark; ComponentLink13Description: https://datasheet.octopart.com:443/CRCW040210K0FKEDHP-Vishay-datasheet-21226360.pdf?src-supplier=Newark; ComponentLink14URL: https://datasheet.octopart.com:443/CRCW040210K0FKEDHP-Vishay-Draloric-datasheet-8359436.pdf?src-supplier=Newark; ComponentLink14Description: https://datasheet.octopart.com:443/CRCW040210K0FKEDHP-Vishay-Draloric-datasheet-8359436.pdf?src-supplier=Newark; ComponentLink15URL: https://datasheet.octopart.com:443/CRCW040210K0FKEDHP-Vishay-datasheet-87136057.pdf?src-supplier=Farnell; ComponentLink15Description: https://datasheet.octopart.com:443/CRCW040210K0FKEDHP-Vishay-datasheet-87136057.pdf?src-supplier=Farnell; ComponentLink16URL: https://datasheet.octopart.com:443/CRCW040210K0FKEDHP-Vishay-datasheet-37143532.pdf?src-supplier=Farnell; ComponentLink16Description: https://datasheet.octopart.com:443/CRCW040210K0FKEDHP-Vishay-datasheet-37143532.pdf?src-supplier=Farnell; ComponentLink17URL: https://datasheet.octopart.com:443/CRCW040210K0FKEDHP-Vishay-datasheet-41195455.pdf?src-supplier=Farnell; ComponentLink17Description: https://datasheet.octopart.com:443/CRCW040210K0FKEDHP-Vishay-datasheet-41195455.pdf?src-supplier=Farnell; ComponentLink18URL: https://datasheet.octopart.com:443/CRCW040210K0FKEDHP.-Vishay-datasheet-66581887.pdf?src-supplier=Farnell; ComponentLink18Description: https://datasheet.octopart.com:443/CRCW040210K0FKEDHP.-Vishay-datasheet-66581887.pdf?src-supplier=Farnell; ComponentLink19URL: https://datasheet.octopart.com:443/CRCW040210K0FKEDHP-Vishay-datasheet-62317933.pdf?src-supplier=element14+APAC; ComponentLink19Description: https://datasheet.octopart.com:443/CRCW040210K0FKEDHP-Vishay-datasheet-62317933.pdf?src-supplier=element14+APAC; ComponentLink20URL: https://datasheet.octopart.com:443/CRCW040210K0FKEDHP-Vishay-Dale-datasheet-41169523.pdf?src-supplier=element14+APAC; ComponentLink20Description: https://datasheet.octopart.com:443/CRCW040210K0FKEDHP-Vishay-Dale-datasheet-41169523.pdf?src-supplier=element14+APAC; ComponentLink21URL: https://datasheet.octopart.com:443/CRCW040210K0FKEDHP-Vishay-datasheet-192322387.pdf?src-supplier=HQonline; ComponentLink21Description: https://datasheet.octopart.com:443/CRCW040210K0FKEDHP-Vishay-datasheet-192322387.pdf?src-supplier=HQonline; ComponentLink22URL: https://datasheet.octopart.com:443/CRCW040210K0FKEDHP-Vishay-datasheet-62316122.pdf?src-supplier=Future+Electronics; ComponentLink22Description: https://datasheet.octopart.com:443/CRCW040210K0FKEDHP-Vishay-datasheet-62316122.pdf?src-supplier=Future+Electronics; ComponentLink23URL: https://datasheet.octopart.com:443/CRCW040210K0FKEDHP-Vishay-Dale-datasheet-47688881.pdf?src-supplier=RS+(Formerly+Allied+Electronics); ComponentLink23Description: https://datasheet.octopart.com:443/CRCW040210K0FKEDHP-Vishay-Dale-datasheet-47688881.pdf?src-supplier=RS+(Formerly+Allied+Electronics); ComponentLink24URL: https://datasheet.octopart.com:443/CRCW040210K0FKEDHP-Vishay-datasheet-11548710.pdf?src-supplier=Arrow+Electronics; ComponentLink24Description: https://datasheet.octopart.com:443/CRCW040210K0FKEDHP-Vishay-datasheet-11548710.pdf?src-supplier=Arrow+Electronics; ComponentLink25URL: http://sigma.octopart.com:80/rohs_statement/Vishay-company-15.pdf?src-supplier=Compliance+Statements; ComponentLink25Description: http://sigma.octopart.com:80/rohs_statement/Vishay-company-15.pdf?src-supplier=Compliance+Statements; Supplier Part Number 1: 541-10.0KYDKR-ND
SW1 SW2 = PTS810SJM250SMTRLFS: Switch Tactile N.O. SPST Button J-Bend 0.05A 16V 150000Cycles 1.569N SMD T/R; Manufacturer: C&K Components; Actuator Length: 711.2µm; Contact Current Rating: 50mA; Contact Resistance: 500mΩ; Electrical Life: 150kcycles; Illumination Type: Non-Illuminated; Insulation Resistance: 100MΩ; Number of Positions: 1; Operating Force: 1.57N; Switch Function: Off-Mom; Switch Travel: 150µm; Supplier 1: DigiKey; Manufacturer Part Number: PTS810SJM250SMTRLFS; RoHS: Compliant; Category: Tactile Switches; Stock 1: 70955; Pricing 1: 1=0.58, 10=0.501, 25=0.4672, 100=0.4173, 250=0.38652, 500=0.36488, 1000=0.34488 (USD); Case/Package: SMD/SMT; Color: Black; Contact Plating: Silver; Country of Origin: Mainland China; Current Rating: 50mA; Depth: 4.6mm; Export Control Classification Number (ECCN) Code: EAR99; Height: 1.8mm; Harmonized Tariff Schedule (HTS) Code: 8536.50.90.40; Introduction Date: 2013-03-04; Lead Free: Lead Free; Length: 4.2mm; Life (Cycles): 150kcycles; Lifecycle Status: Production; Max Current Rating: 50mA; Max Operating Temperature: 85°C; Max Voltage Rating (DC): 16V; Mechanical Life: 150kcycles; Manufacturer Package Identifier: PTS810SJM250SMTRLFS; Min Operating Temperature: -40°C; Mount: Surface Mount; Number of Pins: 4; Orientation: Straight; REACH SVHC: Yes; Termination: Solder; Throw Configuration: SPST; Voltage Rating (DC): 16V; ComponentLink1URL: https://datasheet.octopart.com:443/PTS810SJM250SMTRLFS-C%26K-Components-datasheet-180017475.pdf?src-supplier=IHS; ComponentLink1Description: https://datasheet.octopart.com:443/PTS810SJM250SMTRLFS-C%26K-Components-datasheet-180017475.pdf?src-supplier=IHS; ComponentLink2URL: https://datasheet.octopart.com:443/PTS810SJM250SMTRLFS-C%26K-Components-datasheet-67873722.pdf?src-supplier=Upverter; ComponentLink2Description: https://datasheet.octopart.com:443/PTS810SJM250SMTRLFS-C%26K-Components-datasheet-67873722.pdf?src-supplier=Upverter; ComponentLink3URL: https://datasheet.octopart.com:443/PTS810-SJM-250-SMTR-LFS-C%26K-Components-datasheet-41562126.pdf?src-supplier=Upverter; ComponentLink3Description: https://datasheet.octopart.com:443/PTS810-SJM-250-SMTR-LFS-C%26K-Components-datasheet-41562126.pdf?src-supplier=Upverter; ComponentLink4URL: https://datasheet.octopart.com:443/PTS810SJM250SMTR-LFS-C%26K-Components-datasheet-181955281.pdf?src-supplier=Farnell; ComponentLink4Description: https://datasheet.octopart.com:443/PTS810SJM250SMTR-LFS-C%26K-Components-datasheet-181955281.pdf?src-supplier=Farnell; ComponentLink5URL: https://datasheet.octopart.com:443/PTS810SJM250SMTRLFS-C%26K-Components-datasheet-134606748.pdf?src-supplier=TME; ComponentLink5Description: https://datasheet.octopart.com:443/PTS810SJM250SMTRLFS-C%26K-Components-datasheet-134606748.pdf?src-supplier=TME; ComponentLink6URL: https://datasheet.octopart.com:443/PTS810-SJM-250-SMTR-LFS-C%26K-Components-datasheet-151508687.pdf?src-supplier=TME; ComponentLink6Description: https://datasheet.octopart.com:443/PTS810-SJM-250-SMTR-LFS-C%26K-Components-datasheet-151508687.pdf?src-supplier=TME; ComponentLink7URL: http://sigma.octopart.com:80/reach_statement/ITT-company-18.pdf?src-supplier=Compliance+Statements; ComponentLink7Description: http://sigma.octopart.com:80/reach_statement/ITT-company-18.pdf?src-supplier=Compliance+Statements
U1 = STM32G431C6T6: Microcontroller 32-Bit ARM Cortex-M4 RISC 32K-Byte Flash 3.3V 48-Pin LQFP; Manufacturer: STMicroelectronics; ADC Channels (Resolution): 17-Ch 12-Bit; DAC Channels (Resolution): 4-Ch 12-Bit; EEPROM Memory Size: 0B; Flash Memory Size: 32kB; Frequency: 170MHz; Interface: USB; Max Frequency: 48MHz; Max Supply Current: 29mA; Max Supply Voltage: 3.6V; Min Supply Voltage: 1.71V; Nominal Supply Voltage (DC): 3V; Number of A/D Converters: 2; Number of Channels: 17; Number of I2C Channels: 3; Number of I/Os: 5; Number of Interrupts: 16; Number of Timers/Counters: 12; Peripherals: POR; Supplier 1: Future Electronics; Manufacturer Part Number: STM32G431C6T6; RoHS: Compliant; Category: Microcontrollers; Stock 1: 1500; Pricing 1: 1500=2.29 (USD); Case/Package: LFQFP; China RoHS: Compliant; Core Architecture: ARM Cortex-M4; Country of Origin: Mainland China, Taiwan; Export Control Classification Number (ECCN) Code: 3A991.A.2; Height - Seated (Max): 1.6mm; Harmonized Tariff Schedule (HTS) Code: 8542.31.00.25; Introduction Date: 2019-10-29; Length: 7mm; Lifecycle Status: Production; Max Operating Temperature: 85°C; Memory Type: FLASH; Min Operating Temperature: -40°C; Number of D/A Converters: 2; Number of SPI Channels: 3; Number of Terminals: 48; Number of USART Channels: 3; RAM Size: 32kB; REACH SVHC: Yes; Schedule B: 8542310000, 8542310000|8542310000|8542310000|8542310000|8542310000; Terminal Pitch: 500µm; Width: 7mm; ComponentLink1URL: https://datasheet.octopart.com:443/STM32G431C6T6-STMicroelectronics-datasheet-159144895.pdf?src-supplier=Newark; ComponentLink1Description: https://datasheet.octopart.com:443/STM32G431C6T6-STMicroelectronics-datasheet-159144895.pdf?src-supplier=Newark; ComponentLink2URL: https://datasheet.octopart.com:443/STM32G431C6T6-STMicroelectronics-datasheet-144618855.pdf?src-supplier=TME; ComponentLink2Description: https://datasheet.octopart.com:443/STM32G431C6T6-STMicroelectronics-datasheet-144618855.pdf?src-supplier=TME; Supplier Part Number 1: STM32G431C6T6
Y1 = TSX-3225 24.0000MF15X-AC3: Crystal 24MHz ±10ppm (Tol) ±15ppm (Stability) 9pF FUND 40Ohm 4-Pin Mini-CSMD T/R; Manufacturer: Epson; ESR (Equivalent Series Resistance): 40Ω; Frequency Tolerance: 0.001%; Supplier 1: DigiKey; Manufacturer Part Number: TSX-3225 24.0000MF15X-AC3; RoHS: Compliant; Category: Crystals; Stock 1: 44842; Pricing 1: 1=0.82, 10=0.714, 25=0.6748, 50=0.647, 100=0.6202 (USD); Case/Package: SMD/SMT; China RoHS: Compliant; Frequency: 24MHz; Frequency Stability: 15ppm; Height: 609.6µm; Lead Free: Lead Free; Length: 3.2004mm; Lifecycle Status: Production; Load Capacitance: 9pF; Max Operating Temperature: 85°C; Min Operating Temperature: -40°C; Mount: Surface Mount; REACH SVHC: Yes; Schedule B: 8541600060, 8541600060|8541600060|8541600060|8541600060|8541600060; Series Resistance: 40Ω; Termination: SMD/SMT; Tolerance: 0.001%; Weight: 15.989131mg; Width: 2.4892mm; ComponentLink1URL: https://datasheet.octopart.com:443/TSX-3225-24.0000MF15X-AC3-Epson-datasheet-61114919.pdf?src-supplier=ODG+(Origin+Data+Global); ComponentLink1Description: https://datasheet.octopart.com:443/TSX-3225-24.0000MF15X-AC3-Epson-datasheet-61114919.pdf?src-supplier=ODG+(Origin+Data+Global); ComponentLink2URL: https://datasheet.octopart.com:443/TSX-322524.0000MF15X-AC3-Epson-datasheet-180707711.pdf?src-supplier=IHS; ComponentLink2Description: https://datasheet.octopart.com:443/TSX-322524.0000MF15X-AC3-Epson-datasheet-180707711.pdf?src-supplier=IHS; ComponentLink3URL: https://datasheet.octopart.com:443/TSX-3225-24.0000MF15X-AC3-Epson-datasheet-141944207.pdf?src-supplier=Arrow.cn; ComponentLink3Description: https://datasheet.octopart.com:443/TSX-3225-24.0000MF15X-AC3-Epson-datasheet-141944207.pdf?src-supplier=Arrow.cn; ComponentLink4URL: http://sigma.octopart.com:80/149135495/reach_statement/Epson-TSX-3225-24.0000MF15X-AC3.pdf?src-supplier=Compliance+Statements; ComponentLink4Description: http://sigma.octopart.com:80/149135495/reach_statement/Epson-TSX-3225-24.0000MF15X-AC3.pdf?src-supplier=Compliance+Statements; ComponentLink5URL: http://sigma.octopart.com:80/149135496/rohs_statement/Epson-TSX-3225-24.0000MF15X-AC3.pdf?src-supplier=Compliance+Statements; ComponentLink5Description: http://sigma.octopart.com:80/149135496/rohs_statement/Epson-TSX-3225-24.0000MF15X-AC3.pdf?src-supplier=Compliance+Statements